# Altium schematic sheet DAC_SHEET.SchDoc
size A; SheetNumber: 5; SheetTotal: 9
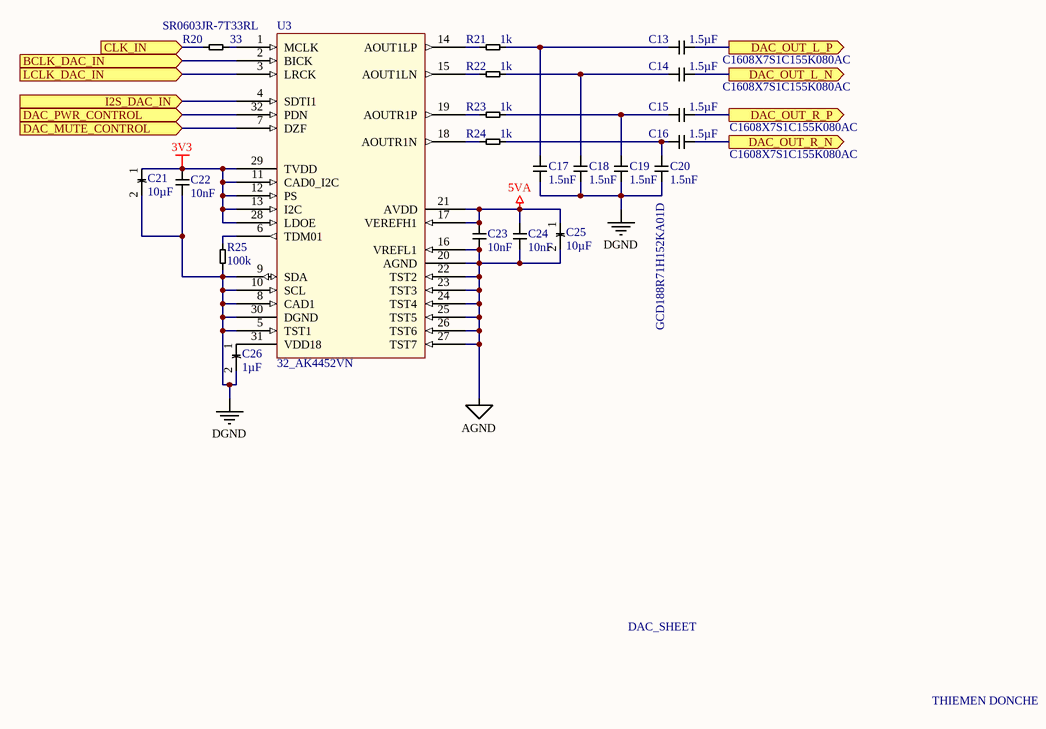
[diagram p0: DAC_SHEET.SchDoc]

## Parts
C13  1.5µF  type: C1608X7S1C155K080AC  [0603_SMD_CAP]
C14  1.5µF  type: C1608X7S1C155K080AC  [0603_SMD_CAP]
C15  1.5µF  type: C1608X7S1C155K080AC  [0603_SMD_CAP]
C16  1.5µF  type: C1608X7S1C155K080AC  [0603_SMD_CAP]
C17  1.5nF  [0603_SMD_CAP]
C18  1.5nF  [0603_SMD_CAP]
C19  1.5nF  [0603_SMD_CAP]
C20  1.5nF  type: GCD188R71H152KA01D  [0603_SMD_CAP]
C21  10µF  [4.0-5.5_ELCO-CAP]
C22  10nF  [0603_SMD_CAP]
C23  10nF  [0603_SMD_CAP]
C24  10nF  [0603_SMD_CAP]
C25  10µF  [4.0-5.5_ELCO-CAP]
C26  1µF  [4.0-5.5_ELCO-CAP]
R20  33  type: SR0603JR-7T33RL  [0603_SMD_PACKAGE]
R21  1k  [0603_SMD_PACKAGE]
R22  1k  [0603_SMD_PACKAGE]
R23  1k  [0603_SMD_PACKAGE]
R24  1k  [0603_SMD_PACKAGE]
R25  100k  [0603_SMD_PACKAGE]
U3  32_AK4452VN  [QFN-32_AK4452VN]

## Ports
BCLK_DAC_IN (in, see TOP_SHEET[1C]), CLK_IN (in, see TOP_SHEET[1C]), DAC_MUTE_CONTROL (in, see TOP_SHEET[1C], ADAU_PERIPHERALS[3B]), DAC_OUT_L_N (out, see TOP_SHEET[2C]), DAC_OUT_L_P (out, see TOP_SHEET[2B]), DAC_OUT_R_N (out, see TOP_SHEET[2C]), DAC_OUT_R_P (out, see TOP_SHEET[2C]), DAC_PWR_CONTROL (in, see TOP_SHEET[1C], ESP_SHEET[1C]), I2S_DAC_IN (in, see TOP_SHEET[1B]), LCLK_DAC_IN (in, see TOP_SHEET[1C])

## Nets
3V3: C21.1 C22.2 U3.11(CAD0_I2C) U3.12(PS) U3.13(I2C) U3.28(LDOE) U3.29(TVDD)
5VA: C23.2 C24.2 C25.1 U3.17(VEREFH1) U3.21(AVDD)
AGND: C23.1 C24.1 C25.2 U3.16(VREFL1) U3.20(AGND) U3.22(TST2) U3.23(TST3) U3.24(TST4) U3.25(TST5) U3.26(TST6) U3.27(TST7)
DGND: C17.2 C18.2 C19.2 C20.2 C21.2 C22.1 C26.2 R25.1 U3.5(TST1) U3.8(CAD1) U3.9(SDA) U3.10(SCL) U3.30(DGND)
BCLK_DAC_IN: U3.2(BICK) ; port BCLK_DAC_IN
CLK_IN: R20.1 ; port CLK_IN
DAC_MUTE_CONTROL: U3.7(DZF) ; port DAC_MUTE_CONTROL
DAC_OUT_L_N: C14.2 ; port DAC_OUT_L_N
DAC_OUT_L_P: C13.2 ; port DAC_OUT_L_P
DAC_OUT_R_N: C16.2 ; port DAC_OUT_R_N
DAC_OUT_R_P: C15.2 ; port DAC_OUT_R_P
DAC_PWR_CONTROL: U3.32(PDN) ; port DAC_PWR_CONTROL
I2S_DAC_IN: U3.4(SDTI1) ; port I2S_DAC_IN
LCLK_DAC_IN: U3.3(LRCK) ; port LCLK_DAC_IN
NetC13_1: C13.1 C17.1 R21.2
NetC14_1: C14.1 C18.1 R22.2
NetC15_1: C15.1 C19.1 R23.2
NetC16_1: C16.1 C20.1 R24.2
NetC26_1: C26.1 U3.31(VDD18)
NetR20_2: R20.2 U3.1(MCLK)
NetR21_1: R21.1 U3.14(AOUT1LP)
NetR22_1: R22.1 U3.15(AOUT1LN)
NetR23_1: R23.1 U3.19(AOUTR1P)
NetR24_1: R24.1 U3.18(AOUTR1N)
NetR25_2: R25.2 U3.6(TDM01)

## Notes on the sheet
- DAC_SHEET
- THIEMEN DONCHE

## Library data of the parts
C13-C20 C22-C24 = ceramic capacator
  C17-C19 C22-C24: type: *
C21 C25 C26 = electrolitische condensator: type: *; Supplier 1: Farnell; Supplier Part Number 1: 865090640005
R20-R25 = resistor
  R21-R25: type: *
U3 = 32_AK4452VN: DAC, 32bit, 2 output differential, I2S+PCM, 3.3VD, 5VA; Supplier 1: Mouser; Supplier Part Number 1: 412-AK4452VN